# Altium schematic sheet Driver.SchDoc
size E; SheetNumber: 2; SheetTotal: 2
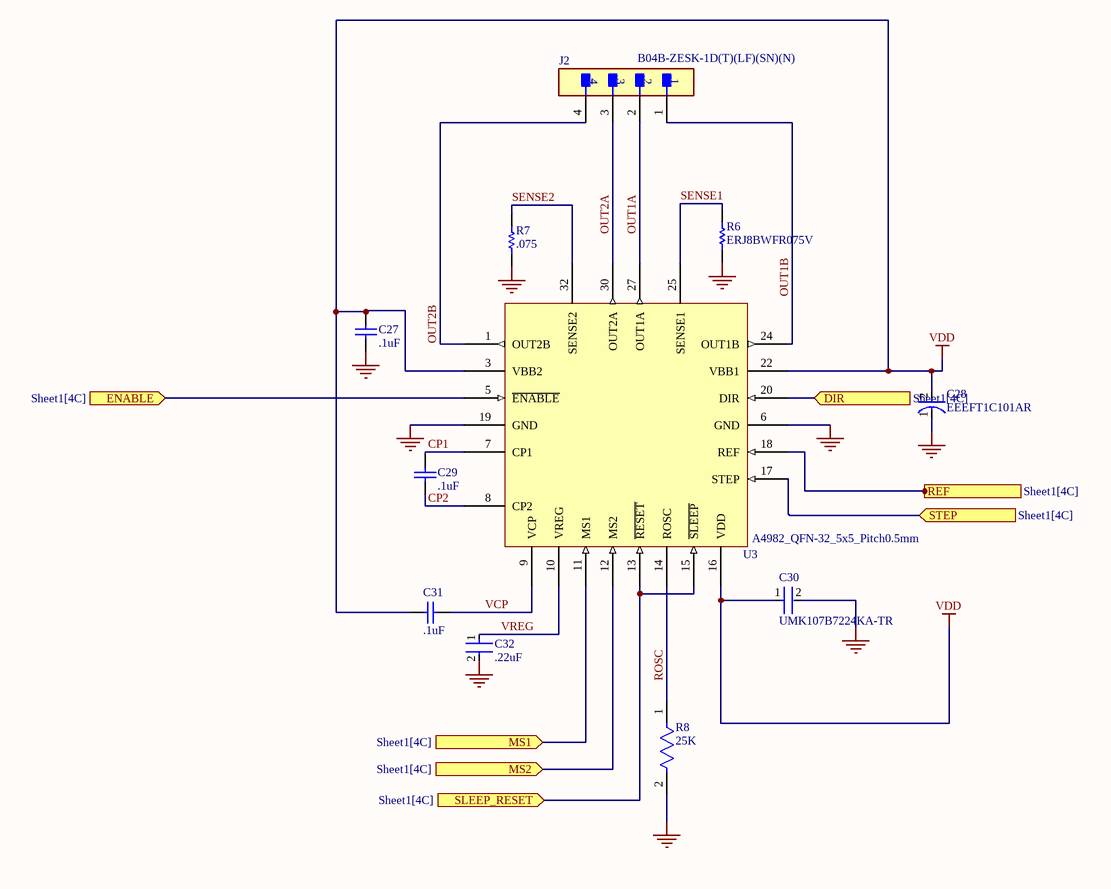
[diagram p0: Driver.SchDoc]

## Parts
C27  .1uF  [CAPC1608X90X35NL15T15]
C28  EEEFT1C101AR  [FP-FTC-MFG]
C29  .1uF  [CAPC1608X90X35NL15T15]
C30  UMK107B7224KA-TR  [FP-0603-L_1_6_0_1-W_0_8_0-IPC_A]
C31  .1uF  [CAPC1608X90X35NL15T15]
C32  .22uF  [FP-0603-L_1_6_0_1-W_0_8_0-IPC_A]
J2  B04B-ZESK-1D(T)(LF)(SN)(N)  [FP-B04B-ZESK-1D_T_LF_SN-MFG]
R6  ERJ8BWFR075V  [RESC3216X70X50LL05T20]
R7  .075  [RESC3216X70X50LL05T20]
R8  25K  [FP-MCR03-IPC_A]
U3  A4982_QFN-32_5x5_Pitch0.5mm  [QFN50P500X500X80_HS-33N]

## Ports
DIR (in, see Sheet1[4C]), ENABLE (in, see Sheet1[4C]), MS1 (in, see Sheet1[4C]), MS2 (in, see Sheet1[4C]), REF (in, see Sheet1[4C]), SLEEP_RESET (in, see Sheet1[4C]), STEP (in, see Sheet1[4C])

## Nets
GND: C27.2 C28.1(C) C30.2 C32.2 R6.1 R7.1 R8.2 U3.6(GND) U3.19(GND)
VDD: C27.1 C28.2(A) C30.1 C31.1 U3.3(VBB2) U3.16(VDD) U3.22(VBB1)
CP1: C29.2 U3.7(CP1)
CP2: C29.1 U3.8(CP2)
DIR: U3.20(DIR) ; port DIR
ENABLE: U3.5(~{ENABLE}) ; port ENABLE
MS1: U3.11(MS1) ; port MS1
MS2: U3.12(MS2) ; port MS2
OUT1A: J2.2 U3.27(OUT1A)
OUT1B: J2.1 U3.24(OUT1B)
OUT2A: J2.3 U3.30(OUT2A)
OUT2B: J2.4 U3.1(OUT2B)
REF: U3.18(REF) ; port REF
ROSC: R8.1 U3.14(ROSC)
SENSE1: R6.2 U3.25(SENSE1)
SENSE2: R7.2 U3.32(SENSE2)
SLEEP_RESET: U3.13(~{RESET}) U3.15(~{SLEEP}) ; port SLEEP_RESET
STEP: U3.17(STEP) ; port STEP
VCP: C31.2 U3.9(VCP)
VREG: C32.1 U3.10(VREG)

Not connected (* = marked no-connect by the designer): U3 33(PAD)

## Notes on the sheet
- (in symbol CMP-05427-000077-1) +

## Library data of the parts
C27 C29 C31 = CMP-2006-04490-1: Part Number: 0603YC104JAT4A; Manufacturer: AVX Interconnect / Elco
C28 = CMP-05427-000077-1: CAP ALUM 100UF 20% 16V SMD; Life (Hours): 2000Hour; Ripple Current: 240mA; Leakage Current: 16uA; Lead Diameter: 0.65mm; ESR (Equivalent Series Resistance): 360mR; Capacitance: 100uF; Voltage Rating: 16V; Lead Pitch: 1.5mm; RoHS Compliant: Yes; Mount: Surface Mount; Tolerance: 20%; Contact Plating: Tin; Length: 5.8mm; Voltage: 16V; REACH SVHC: No SVHC; Max Operating Temperature: 105°C; Series: FT; Min Operating Temperature: -55°C; Diameter: 5mm; Case/Package: Radial; Radiation Hardening: No; Height - Seated (Max): 0.24inch; Construction: Cylindrical; Packaging: Tape and Reel; Voltage Rating (DC): 16V; Termination: SMD/SMT; Package Quantity: 1000; Ripple Current (AC): 240mA; Height: 5.8mm
C30 C32 = CMP-14477-002410-2: None; Voltage: 50V; Dielectric: X7R; Capacitance: 220nF; Tolerance: 10%; Construction: Flat; Max Operating Temperature: 125°C; Series: M; Width: 0.8mm; Thickness: 0.035inch; Case/Package: 0603; Voltage Rating (DC): 50V; Radiation Hardening: No; Voltage Rating: 50V; Height: 0.8mm; Length: 1.6mm; Halogen Free: Halogen Free; Min Operating Temperature: -55°C; RoHS Compliant: Yes; Packaging: Tape and Reel; Depth: 0.8mm; Package Quantity: 4000; Case Code (Imperial): 0603; Case Code (Metric): 1608; Termination: SMD/SMT; Mount: Surface Mount
J2 = CMP-17439-000625-1: CONN HEADER VERT 4POS 1.5MM; Pitch: 0.059inch; Number of Positions: 4; Gender: Male; Voltage Rating: 100V; Connector Type: Header; Packaging: Tray; Insulation Color: Natural; Min Operating Temperature: -25°C; Package Quantity: 1664; Contact Material: Copper Alloy; Contact Finish - Mating: TIN; Flammability Rating: UL94 V-0; Contact Shape: Rectangular; Termination: Kinked Pin; Number of Rows: 1; Insulation Material: Nylon; Contact Type: Outer Shroud Contact; Mount: Through Hole; Color: Natural; Series: ZE; Contact Plating: Tin; Number of Contacts: 4; Fastening Type: Ramp; Max Operating Temperature: 85°C
R6 = CMP-2003-00783-1: Manufacturer: Panasonic; Part Number: ERJ8BWFR075V
R7 = CMP-2003-00783-1: Manufacturer: Panasonic; Part Number: ERJ8BWFR075V
R8 = CMP-08839-020672-1: Thick Film Chip Resistor, 0603, 25kΩ, 5%, 200ppm/°C, 0.1W, 50V
U3 = CMP-00024-00006-11: QFN 32 package for stepper driver a4982